# Altium schematic sheet a0206-2006.3.SchDoc
size 558 x 431 mm
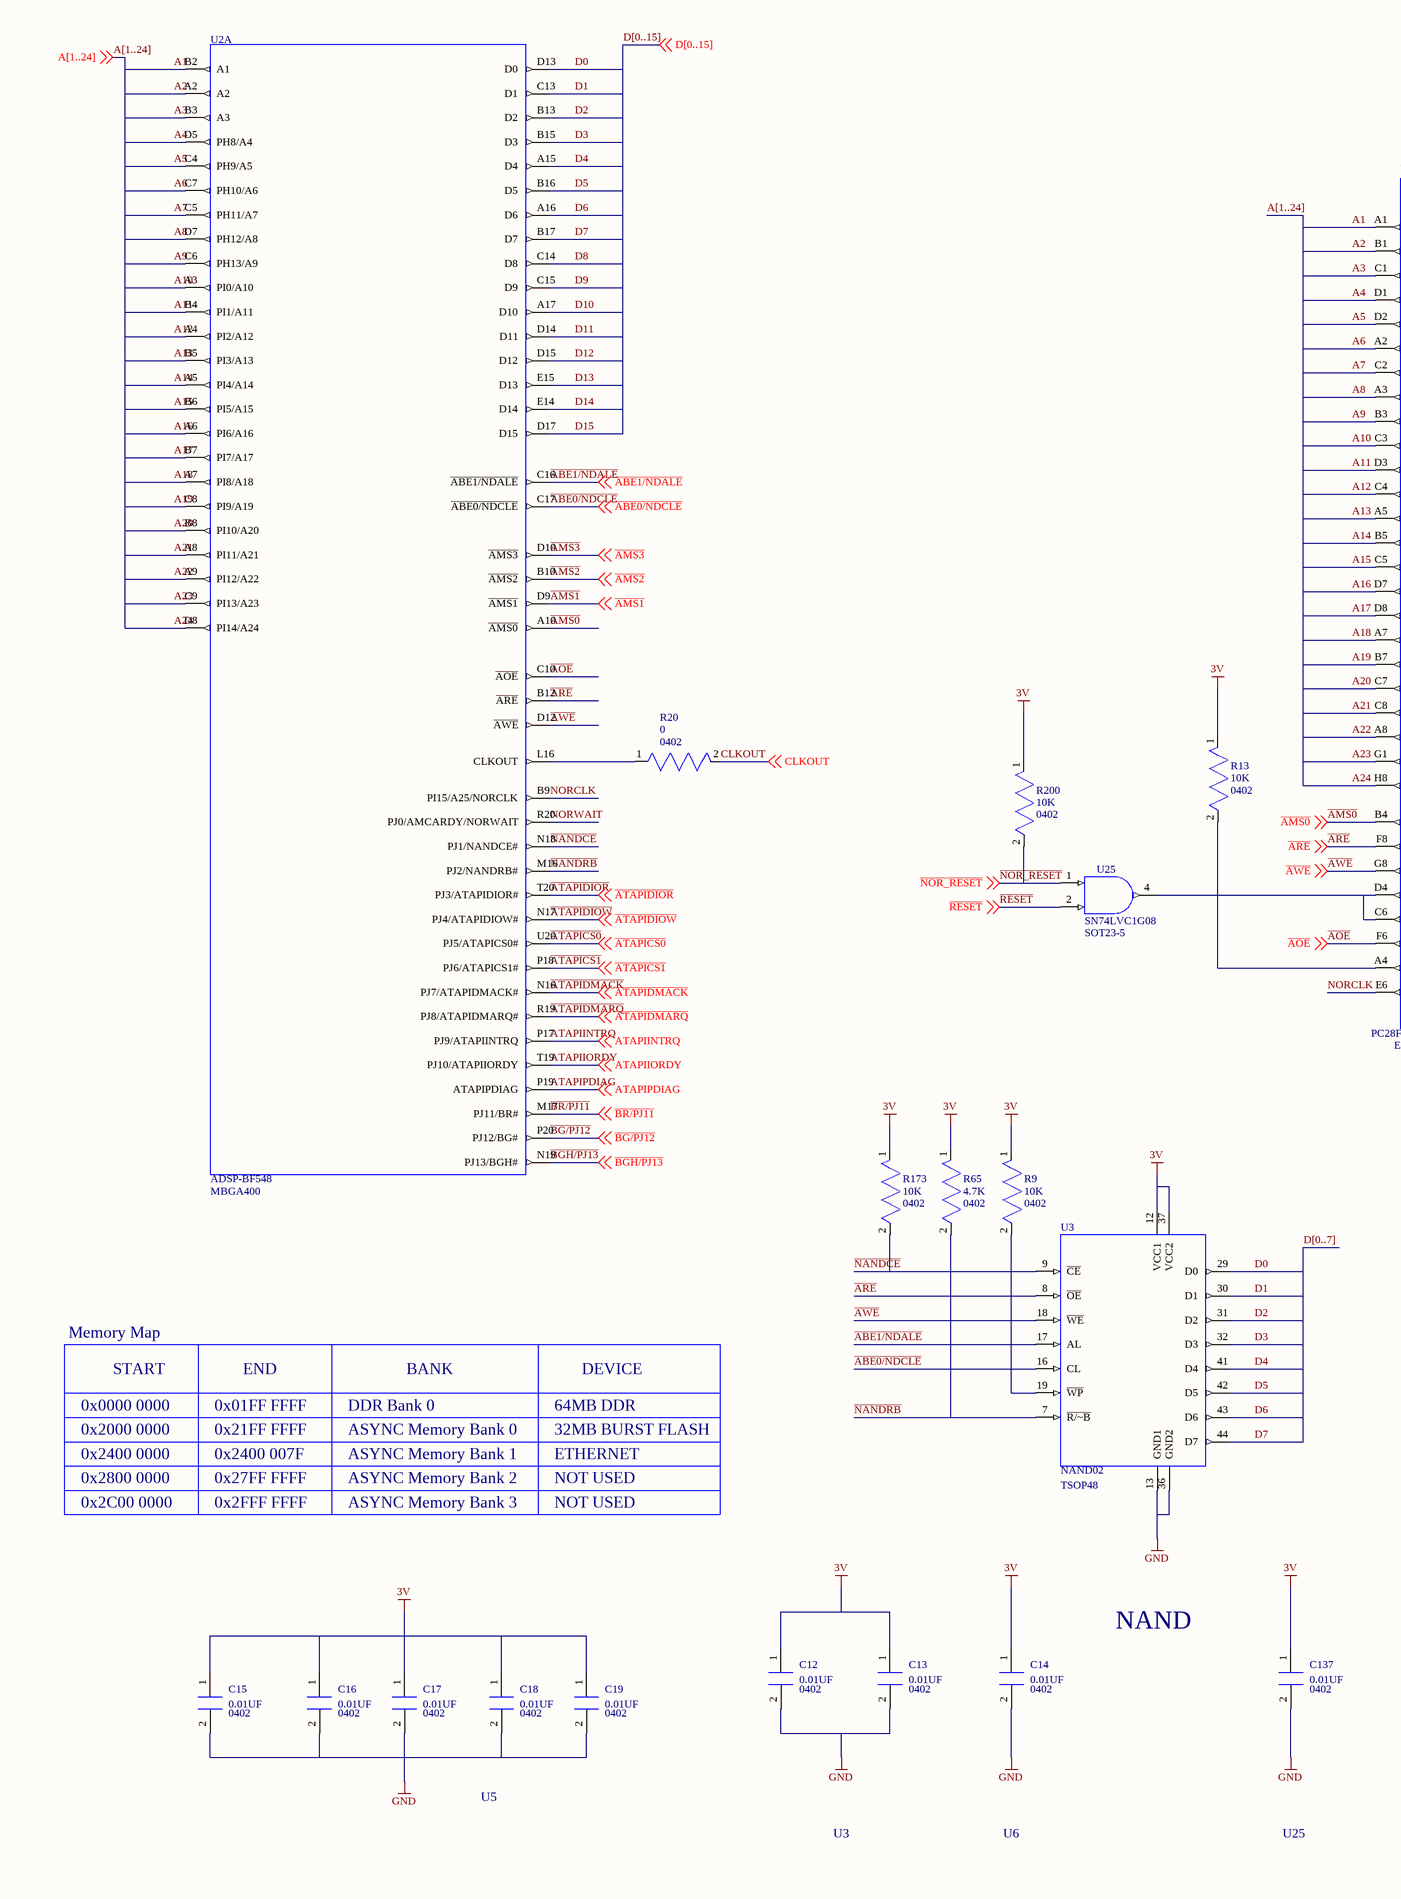
[diagram p0: a0206-2006.3.SchDoc, left]
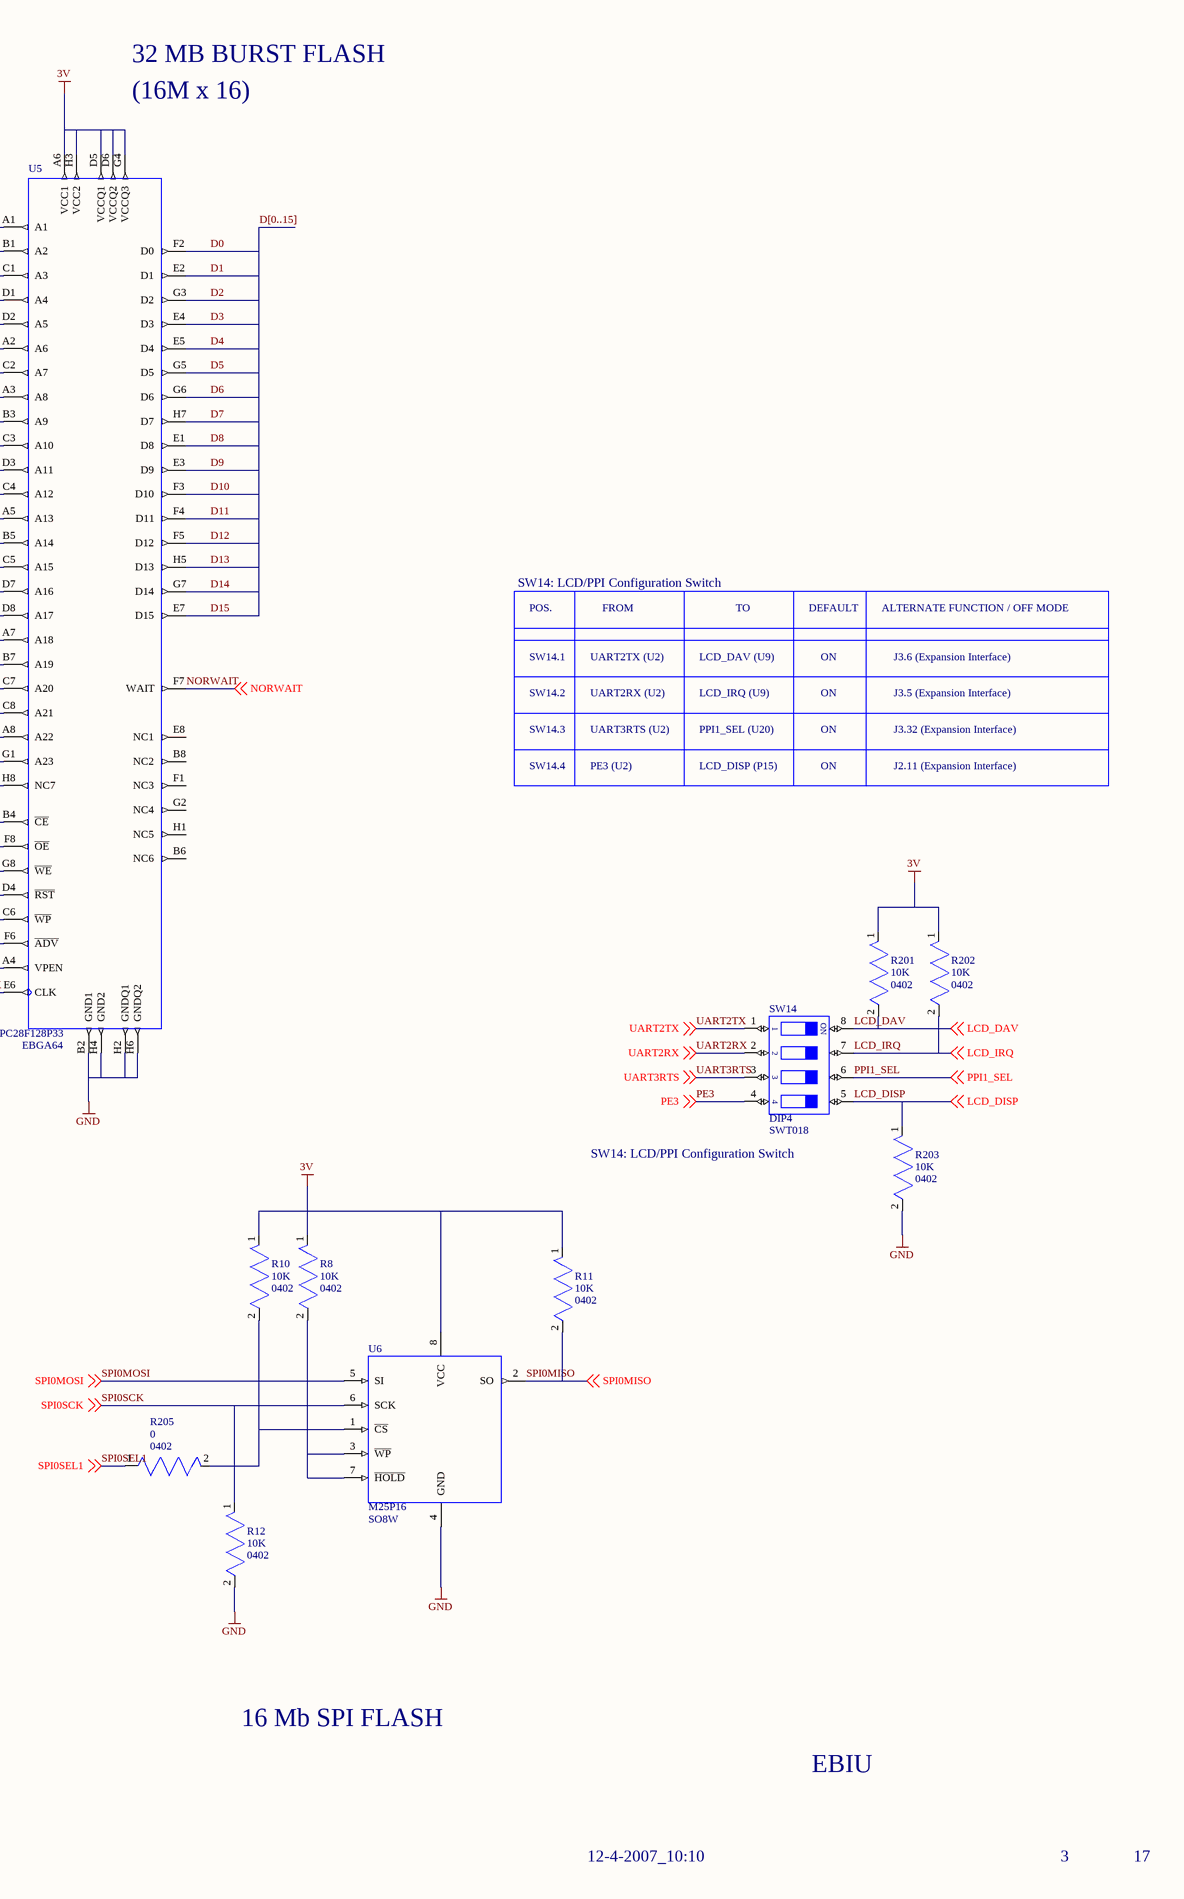
[diagram p1: a0206-2006.3.SchDoc, right]

## Parts
C12  value 0.01UF  [0402]  (hidden comment: *)
C13  value 0.01UF  [0402]  (hidden comment: *)
C14  value 0.01UF  [0402]  (hidden comment: *)
C15  value 0.01UF  [0402]  (hidden comment: *)
C16  value 0.01UF  [0402]  (hidden comment: *)
C17  value 0.01UF  [0402]  (hidden comment: *)
C18  value 0.01UF  [0402]  (hidden comment: *)
C19  value 0.01UF  [0402]  (hidden comment: *)
C137  value 0.01UF  [0402]  (hidden comment: *)
R8  value 10K  [0402]  (hidden comment: *)
R9  value 10K  [0402]  (hidden comment: *)
R10  value 10K  [0402]  (hidden comment: *)
R11  value 10K  [0402]  (hidden comment: *)
R12  value 10K  [0402]  (hidden comment: *)
R13  value 10K  [0402]  (hidden comment: *)
R20  value 0  [0402]  (hidden comment: *)
R65  value 4.7K  [0402]  (hidden comment: *)
R173  value 10K  [0402]  (hidden comment: *)
R200  value 10K  [0402]  (hidden comment: *)
R201  value 10K  [0402]  (hidden comment: *)
R202  value 10K  [0402]  (hidden comment: *)
R203  value 10K  [0402]  (hidden comment: *)
R205  value 0  [0402]  (hidden comment: *)
SW14  value DIP4  [SWT018]  (hidden comment: *)
U2  PART: ADSP-BF548  PKG_TYPE: MBGA400  (hidden comment: ICS_ADSPBF548)  (part A of 7)
U3  PART: NAND02  [TSOP48]  (hidden comment: *)
U5  PART: PC28F128P33  [EBGA64]  (hidden comment: *)
U6  PART: M25P16  [SO8W]  (hidden comment: *)
U25  PART: SN74LVC1G08  [SOT23-5]  (hidden comment: *)

## Nets
3V: C12.1(A) C13.1(A) C14.1(A) C15.1(A) C16.1(A) C17.1(A) C18.1(A) C19.1(A) C137.1(A) R8.1(N1) R9.1(N1) R10.1(N1) R11.1(N1) R13.1(N1) R65.1(N1) R173.1(N1) R200.1(N1) R201.1(N1) R202.1(N1) U3.12(VCC1) U3.37(VCC2) U5.A6(VCC1) U5.D5(VCCQ1) U5.D6(VCCQ2) U5.G4(VCCQ3) U5.H3(VCC2) U6.8(VCC) U25.5(3V)
GND: C12.2(B) C13.2(B) C14.2(B) C15.2(B) C16.2(B) C17.2(B) C18.2(B) C19.2(B) C137.2(B) R12.2(N2) R203.2(N2) U3.13(GND1) U3.36(GND2) U5.B2(GND1) U5.H2(GNDQ1) U5.H4(GND2) U5.H6(GNDQ2) U6.4(GND) U25.3(GND)
A1: U2.B2(A1) U5.A1
A2: U2.A2 U5.B1(A2)
A3: U2.B3(A3) U5.C1(A3)
A4: U2.D5(PH8/A4) U5.D1(A4)
A5: U2.C4(PH9/A5) U5.D2(A5)
A6: U2.C7(PH10/A6) U5.A2(A6)
A7: U2.C5(PH11/A7) U5.C2(A7)
A8: U2.D7(PH12/A8) U5.A3(A8)
A9: U2.C6(PH13/A9) U5.B3(A9)
A10: U2.A3(PI0/A10) U5.C3(A10)
A11: U2.B4(PI1/A11) U5.D3(A11)
A12: U2.A4(PI2/A12) U5.C4(A12)
A13: U2.B5(PI3/A13) U5.A5(A13)
A14: U2.A5(PI4/A14) U5.B5(A14)
A15: U2.B6(PI5/A15) U5.C5(A15)
A16: U2.A6(PI6/A16) U5.D7(A16)
A17: U2.B7(PI7/A17) U5.D8(A17)
A18: U2.A7(PI8/A18) U5.A7(A18)
A19: U2.C8(PI9/A19) U5.B7(A19)
A20: U2.B8(PI10/A20) U5.C7(A20)
A21: U2.A8(PI11/A21) U5.C8(A21)
A22: U2.A9(PI12/A22) U5.A8(A22)
A23: U2.C9(PI13/A23) U5.G1(A23)
A24: U2.D8(PI14/A24) U5.H8(NC7)
~{ABE0/NDCLE}: U2.C17(~{ABE0/NDCLE}) U3.16(CL) ; off-sheet ~{ABE0/NDCLE}
~{ABE1/NDALE}: U2.C16(~{ABE1/NDALE}) U3.17(AL) ; off-sheet ~{ABE1/NDALE}
~{AMS0}: U2.A10(~{AMS0}) U5.B4(~{CE}) ; off-sheet ~{AMS0}
~{AMS1}: U2.D9(~{AMS1}) ; off-sheet ~{AMS1}
~{AMS2}: U2.B10(~{AMS2}) ; off-sheet ~{AMS2}
~{AMS3}: U2.D10(~{AMS3}) ; off-sheet ~{AMS3}
~{AOE}: U2.C10(~{AOE}) U5.F6(~{ADV}) ; off-sheet ~{AOE}
~{ARE}: U2.B12(~{ARE}) U3.8(~{OE}) U5.F8(~{OE}) ; off-sheet ~{ARE}
~{ATAPICS0}: U2.U20(PJ5/ATAPICS0#) ; off-sheet ~{ATAPICS0}
~{ATAPICS1}: U2.P18(PJ6/ATAPICS1#) ; off-sheet ~{ATAPICS1}
~{ATAPIDIOR}: U2.T20(PJ3/ATAPIDIOR#) ; off-sheet ~{ATAPIDIOR}
~{ATAPIDIOW}: U2.N17(PJ4/ATAPIDIOW#) ; off-sheet ~{ATAPIDIOW}
~{ATAPIDMACK}: U2.N16(PJ7/ATAPIDMACK#) ; off-sheet ~{ATAPIDMACK}
~{ATAPIDMARQ}: U2.R19(PJ8/ATAPIDMARQ#) ; off-sheet ~{ATAPIDMARQ}
~{AWE}: U2.D12(~{AWE}) U3.18(~{WE}) U5.G8(~{WE}) ; off-sheet ~{AWE}
ATAPIINTRQ: U2.P17(PJ9/ATAPIINTRQ) ; off-sheet ATAPIINTRQ
ATAPIIORDY: U2.T19(PJ10/ATAPIIORDY) ; off-sheet ATAPIIORDY
ATAPIPDIAG: U2.P19(ATAPIPDIAG) ; off-sheet ATAPIPDIAG
~{BG/PJ12}: U2.P20(PJ12/BG#) ; off-sheet ~{BG/PJ12}
~{BGH/PJ13}: U2.N19(PJ13/BGH#) ; off-sheet ~{BGH/PJ13}
~{BR/PJ11}: U2.M17(PJ11/BR#) ; off-sheet ~{BR/PJ11}
CLKOUT: R20.2(N2) ; off-sheet CLKOUT
D0: U2.D13(D0) U3.29(D0) U5.F2(D0)
D1: U2.C13(D1) U3.30(D1) U5.E2(D1)
D2: U2.B13(D2) U3.31(D2) U5.G3(D2)
D3: U2.B15(D3) U3.32(D3) U5.E4(D3)
D4: U2.A15(D4) U3.41(D4) U5.E5(D4)
D5: U2.B16(D5) U3.42(D5) U5.G5(D5)
D6: U2.A16(D6) U3.43(D6) U5.G6(D6)
D7: U2.B17(D7) U3.44(D7) U5.H7(D7)
D8: U2.C14(D8) U5.E1(D8)
D9: U2.C15(D9) U5.E3(D9)
D10: U2.A17(D10) U5.F3(D10)
D11: U2.D14(D11) U5.F4(D11)
D12: U2.D15(D12) U5.F5(D12)
D13: U2.E15(D13) U5.H5(D13)
D14: U2.E14(D14) U5.G7(D14)
D15: U2.D17(D15) U5.E7(D15)
LCD_DAV: R201.2(N2) SW14.8 ; off-sheet LCD_DAV
LCD_DISP: R203.1(N1) SW14.5 ; off-sheet LCD_DISP
LCD_IRQ: R202.2(N2) SW14.7 ; off-sheet LCD_IRQ
~{NANDCE}: R173.2(N2) U2.N18(PJ1/NANDCE#) U3.9(~{CE})
~{NANDRB}: R65.2(N2) U2.M16(PJ2/NANDRB#) U3.7(~{R/~B})
~{NOR_RESET}: R200.2(N2) U25.1(A) ; off-sheet ~{NOR_RESET}
NORCLK: U2.B9(PI15/A25/NORCLK) U5.E6(CLK)
NORWAIT: U2.R20(PJ0/AMCARDY/NORWAIT) U5.F7(WAIT) ; off-sheet NORWAIT
PE3: SW14.4 ; off-sheet PE3
PPI1_SEL: SW14.6 ; off-sheet PPI1_SEL
~{RESET}: U25.2(B) ; off-sheet ~{RESET}
SPI0MISO: R11.2(N2) U6.2(SO) ; off-sheet SPI0MISO
SPI0MOSI: U6.5(SI) ; off-sheet SPI0MOSI
SPI0SCK: R12.1(N1) U6.6(SCK) ; off-sheet SPI0SCK
SPI0SEL1: R205.1(N1) ; off-sheet SPI0SEL1
UART2RX: SW14.2 ; off-sheet UART2RX
UART2TX: SW14.1 ; off-sheet UART2TX
UART3RTS: SW14.3 ; off-sheet UART3RTS
NetR8_2: R8.2(N2) U6.3(~{WP}) U6.7(~{HOLD})
NetR9_2: R9.2(N2) U3.19(~{WP})
NetR10_2: R10.2(N2) R205.2(N2) U6.1(~{CS})
NetR13_2: R13.2(N2) U5.A4(VPEN)
NetR20_1: R20.1(N1) U2.L16(CLKOUT)
NetU5_C6: U5.C6(~{WP}) U5.D4(~{RST}) U25.4(Y)

Not connected (* = marked no-connect by the designer): U3 1 2 3 4 5 6 10 11 14 15 20 21 22 23 24 25 26 27 28 33 34 35 38 39 40 45 46 47 48; U5 B6(NC6) B8(NC2) E8(NC1) F1(NC3) G2(NC4) H1(NC5)

## Buses and harness runs
bus A[1..24]
bus D[0..7]
bus D[0..15]

## Notes on the sheet
- (16M x 16)
- 32 MB BURST FLASH
- SW14: LCD/PPI Configuration Switch
- SW14.1
- POS.
- UART2TX (U2)
- FROM
- LCD_DAV (U9)
- TO
- DEFAULT
- ON
- ALTERNATE FUNCTION / OFF MODE
- J3.6 (Expansion Interface)
- SW14.2
- UART2RX (U2)
- LCD_IRQ (U9)
- J3.5 (Expansion Interface)
- SW14.3
- SW14.4
- PE3 (U2)
- UART3RTS (U2)
- PPI1_SEL (U20)
- LCD_DISP (P15)
- J2.11 (Expansion Interface)
- J3.32 (Expansion Interface)
- (near SW14) SW14: LCD/PPI Configuration Switch
- Memory Map
- START
- END
- BANK
- DEVICE
- 0x0000 0000
- 0x2000 0000
- 0x2400 0000
- 0x01FF FFFF
- 0x21FF FFFF
- 0x2400 007F
- ASYNC Memory Bank 0
- ASYNC Memory Bank 1
- DDR Bank 0
- 64MB DDR
- 32MB BURST FLASH
- ETHERNET
- 0x2800 0000
- 0x2C00 0000
- 0x27FF FFFF
- 0x2FFF FFFF
- ASYNC Memory Bank 2
- ASYNC Memory Bank 3
- NOT USED
- NAND
- 16 Mb SPI FLASH
- U5
- EBIU
- U3
- U6
- U25
- 12-4-2007_10:10
- 3
- 17
- A
- B
- C
- D
- 1
- 2
- 20 Cotton Road
- 4
- DEVICES
- ANALOG
- Nashua, NH 03063
- PH: 1-800-ANALOGD
- Title
- ADSP-BF548 EZ-KIT LITE
- Size
- Board No.
- A0206-2006
- Rev
- 1.4B
- Date
- Sheet
- of
- (in symbol SW_DIP4.1) ON

## Library data of the parts
C12 C14 C16 C18 = CAP_NON_POLARIZED.2: PART_SPEC: CAPACITOR; LEVEL: STD; TYPE: X7R; BOARDS: BOTH; PRT_NUM: 7000279; VOLTAGE: 16V; TOLERANCE: 10%; PKG_TYPE: 0402; ROHS: ROHS
C13 C15 C17 C19 C137 = CAP_NON_POLARIZED.2: PART_SPEC: CAPACITOR; LEVEL: STD; TOLERANCE: 10%; VOLTAGE: 16V; PRT_NUM: 7000279; BOARDS: BOTH; TYPE: X7R; PKG_TYPE: 0402; ROHS: ROHS
R8 R12 R200 R201 = RES_STANDARD.2: PART_SPEC: RESISTOR; LEVEL: STD; PRT_NUM: 7000280; TOLERANCE: 5%; BOARDS: BOTH; POWER: 1/16W; PKG_TYPE: 0402; ROHS: ROHS
R9-R11 R13 R173 R202 R203 = RES_STANDARD.2: PART_SPEC: RESISTOR; LEVEL: STD; POWER: 1/16W; BOARDS: BOTH; TOLERANCE: 5%; PRT_NUM: 7000280; PKG_TYPE: 0402; ROHS: ROHS
R20 = RES_STANDARD.1: PART_SPEC: RESISTOR; LEVEL: STD; PRT_NUM: 7000282; POWER: 1/16W; TOLERANCE: 5%; PKG_TYPE: 0402; ROHS: ROHS
R65 = RES_STANDARD.2: PART_SPEC: RESISTOR; LEVEL: STD; PRT_NUM: 7000281; TOLERANCE: 5%; BOARDS: BOTH; POWER: 1/16W; PKG_TYPE: 0402; ROHS: ROHS
R205 = RES_STANDARD.1: PART_SPEC: RESISTOR; LEVEL: STD; TOLERANCE: 5%; POWER: 1/16W; PRT_NUM: 7000282; PKG_TYPE: 0402; ROHS: ROHS
SW14 = SW_DIP4.1: PART_SPEC: SWITCH; LEVEL: STD; PRT_NUM: 6000144; PKG_TYPE: SWT018; ROHS: ROHS
U2 = ICS_ADSPBF548_A: 600 MHZ; LEVEL: STD; PRT_NUM: 30-025548-02; DEVICE: ICS_ADSPBF548; ROHS: ROHS; WEB: http://www.analog.com/en/prod/0,2877,ADSP%252DBF548,00.html
U3 = ICS_NAND02.1: 2GBIT_NAND_FLASH; NC: 1,2,3,4,5,6,10,11,14,15,20,21,22,23,24,25,26,27,28,33,34,35,38,39,40,45,46,47,48; LEVEL: STD; PRT_NUM: 1000354; PKG_TYPE: TSOP48; ROHS: ROHS; WEB: http://www.st.com/stonline/stappl/productcatalog/app?path
U5 = PRG_PC28F128P33.1: 16MX16-FLASH; ICS_BASE_PART: 1000424; LEVEL: STD; BD_REFDES: "U5"; BOARD: BF548; PRT_NUM: 1000427; PKG_TYPE: EBGA64; WEB: http://www.intel.com/design/flcomp/datashts/314749.htm; ROHS: ROHS
U6 = PRG_M25P80.1: 16MBIT 3V SERIAL SPI ROM; ICS_BASE_PART: 1000418; LEVEL: STD; BOARD: BF548; BD_REFDES: “U6”; PRT_NUM: 1000445; PKG_TYPE: SO8W; WEB: http://www.st.com/stonline/products/literature/ds/10027/m25p16.htm; ROHS: ROHS
U25 = ICS_SN74XXX1G08.1: SINGLE 2-INPUT AND; LEVEL: STD; PRT_NUM: 1000287; BOARDS: BOTH; PKG_TYPE: SOT23-5; WEB: http://focus.ti.com/docs/prod/folders/print/sn74lvc1g08.html; ROHS: ROHS